# EasyEDA Pro project climbsnail-spotwelder-45c7d2f7.epro, board 大号mos板_16管
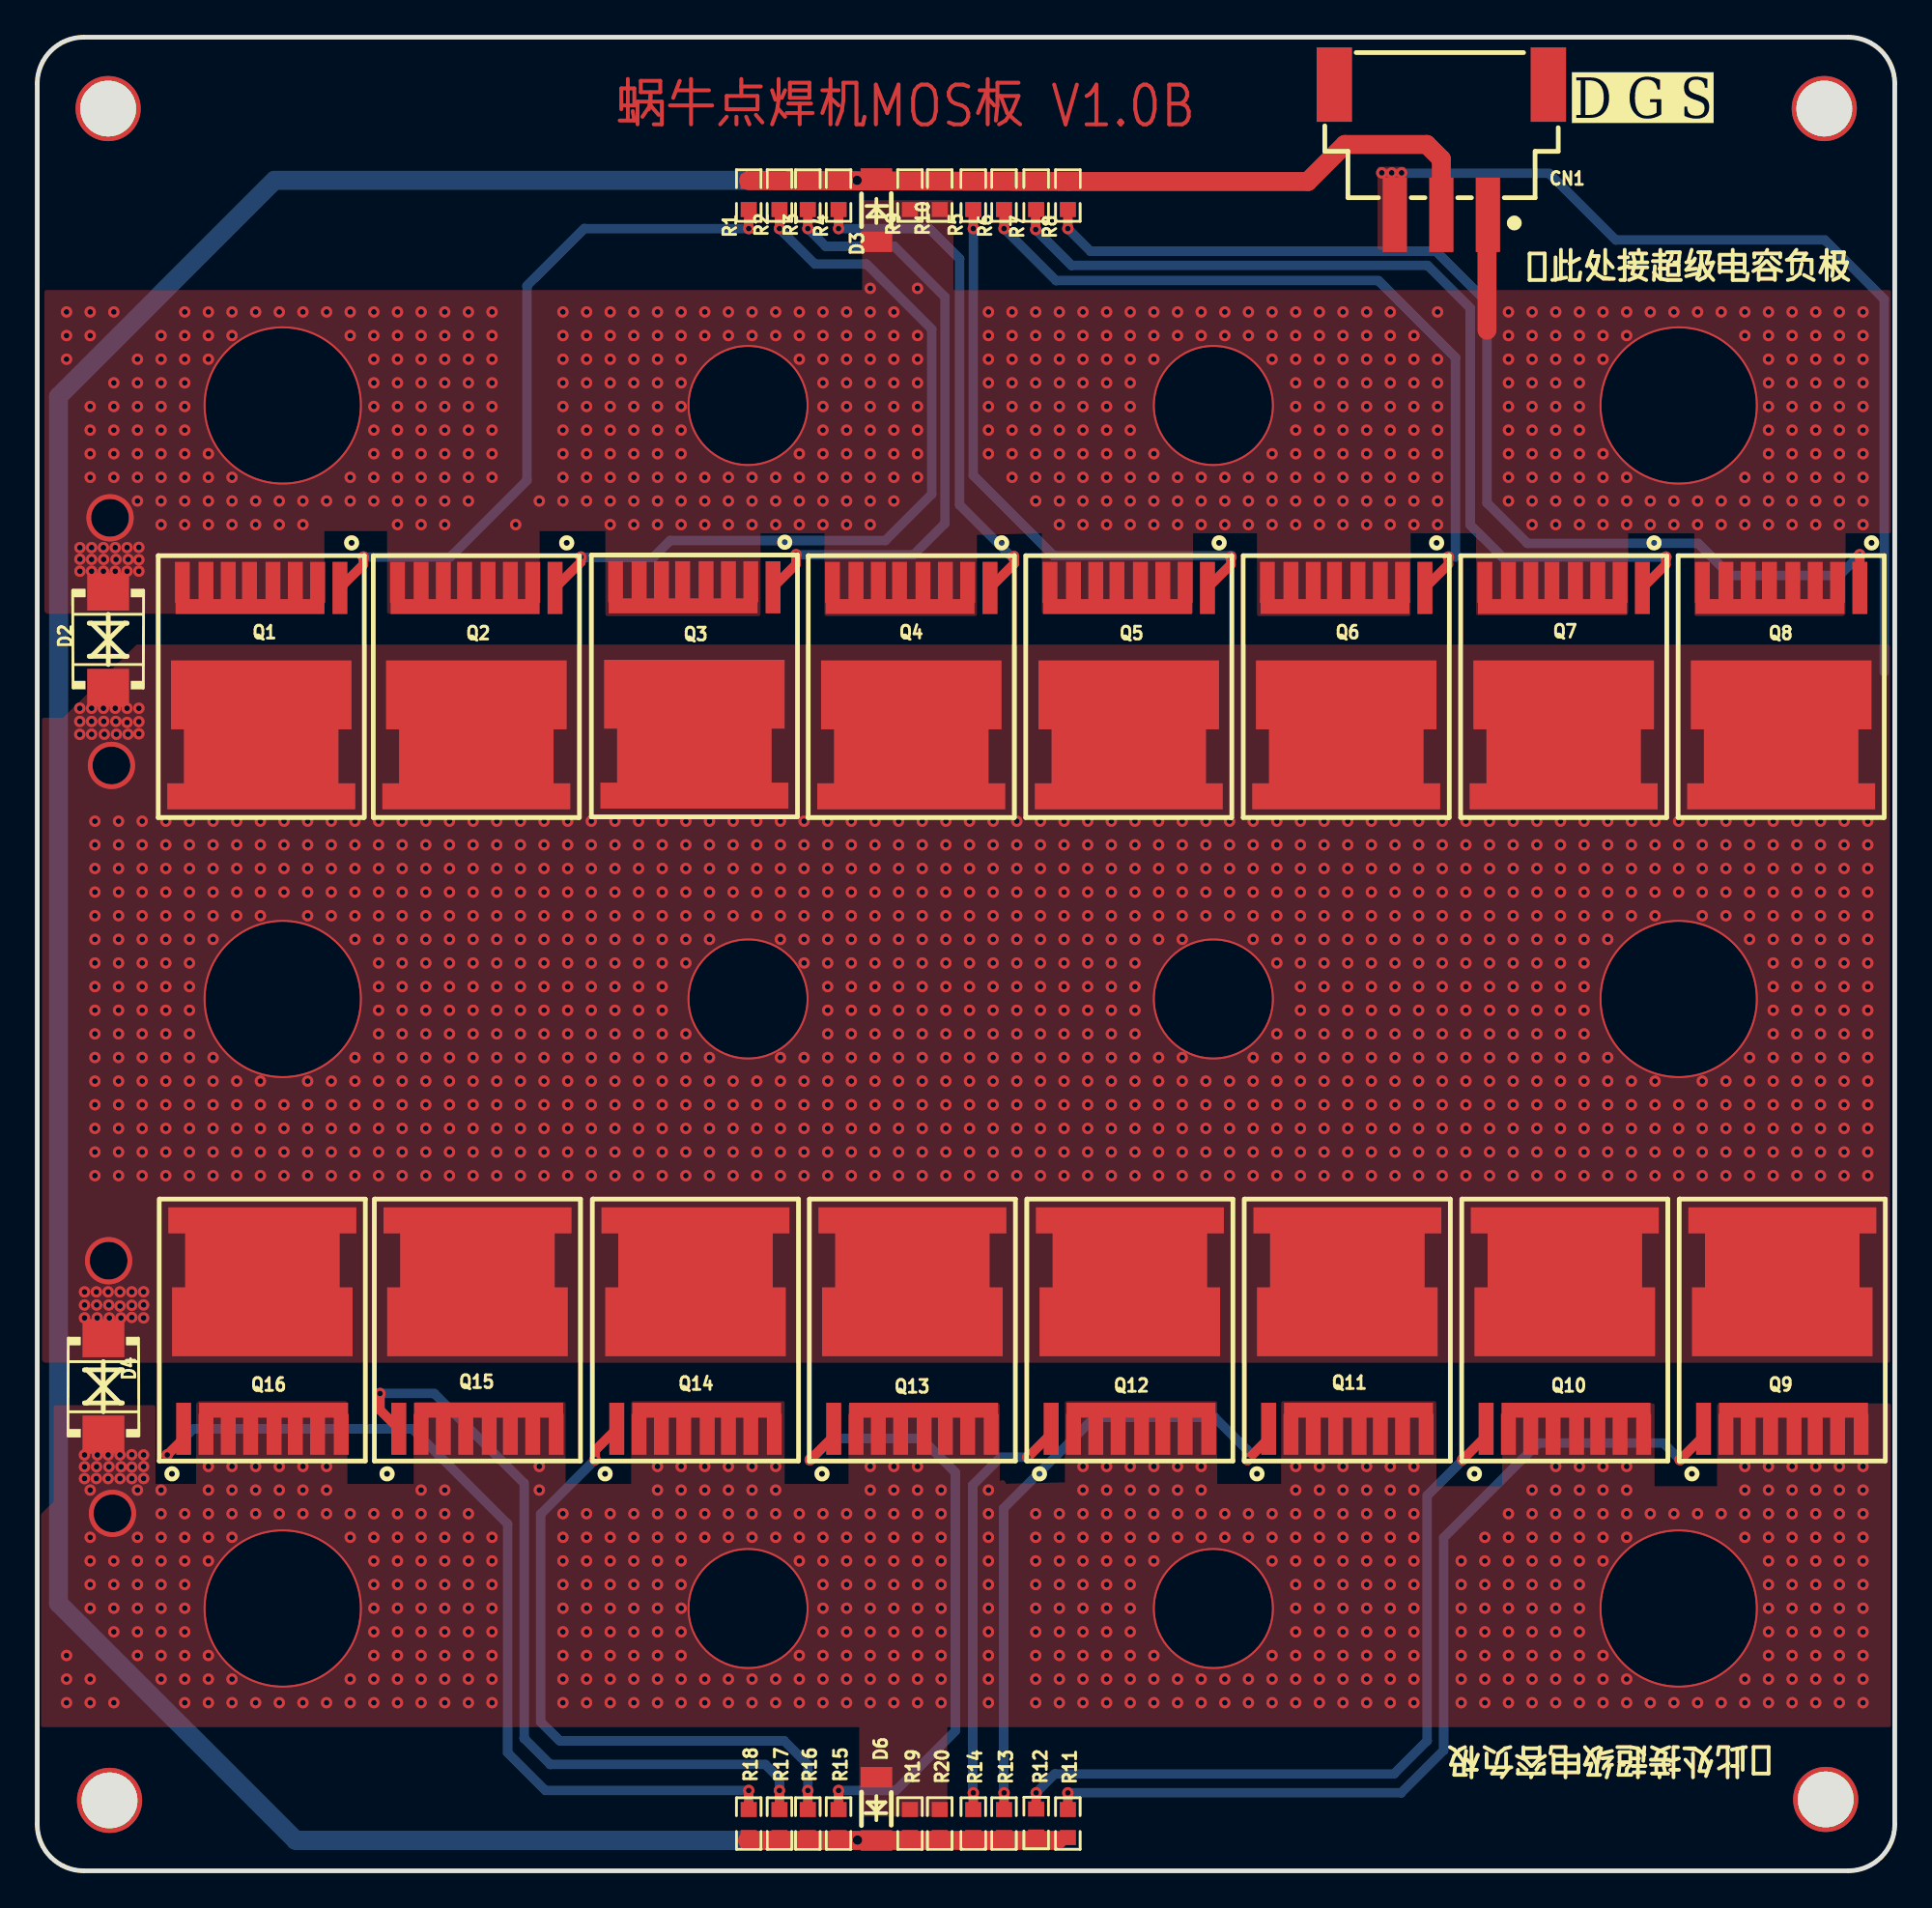
[diagram p12: board, top side]
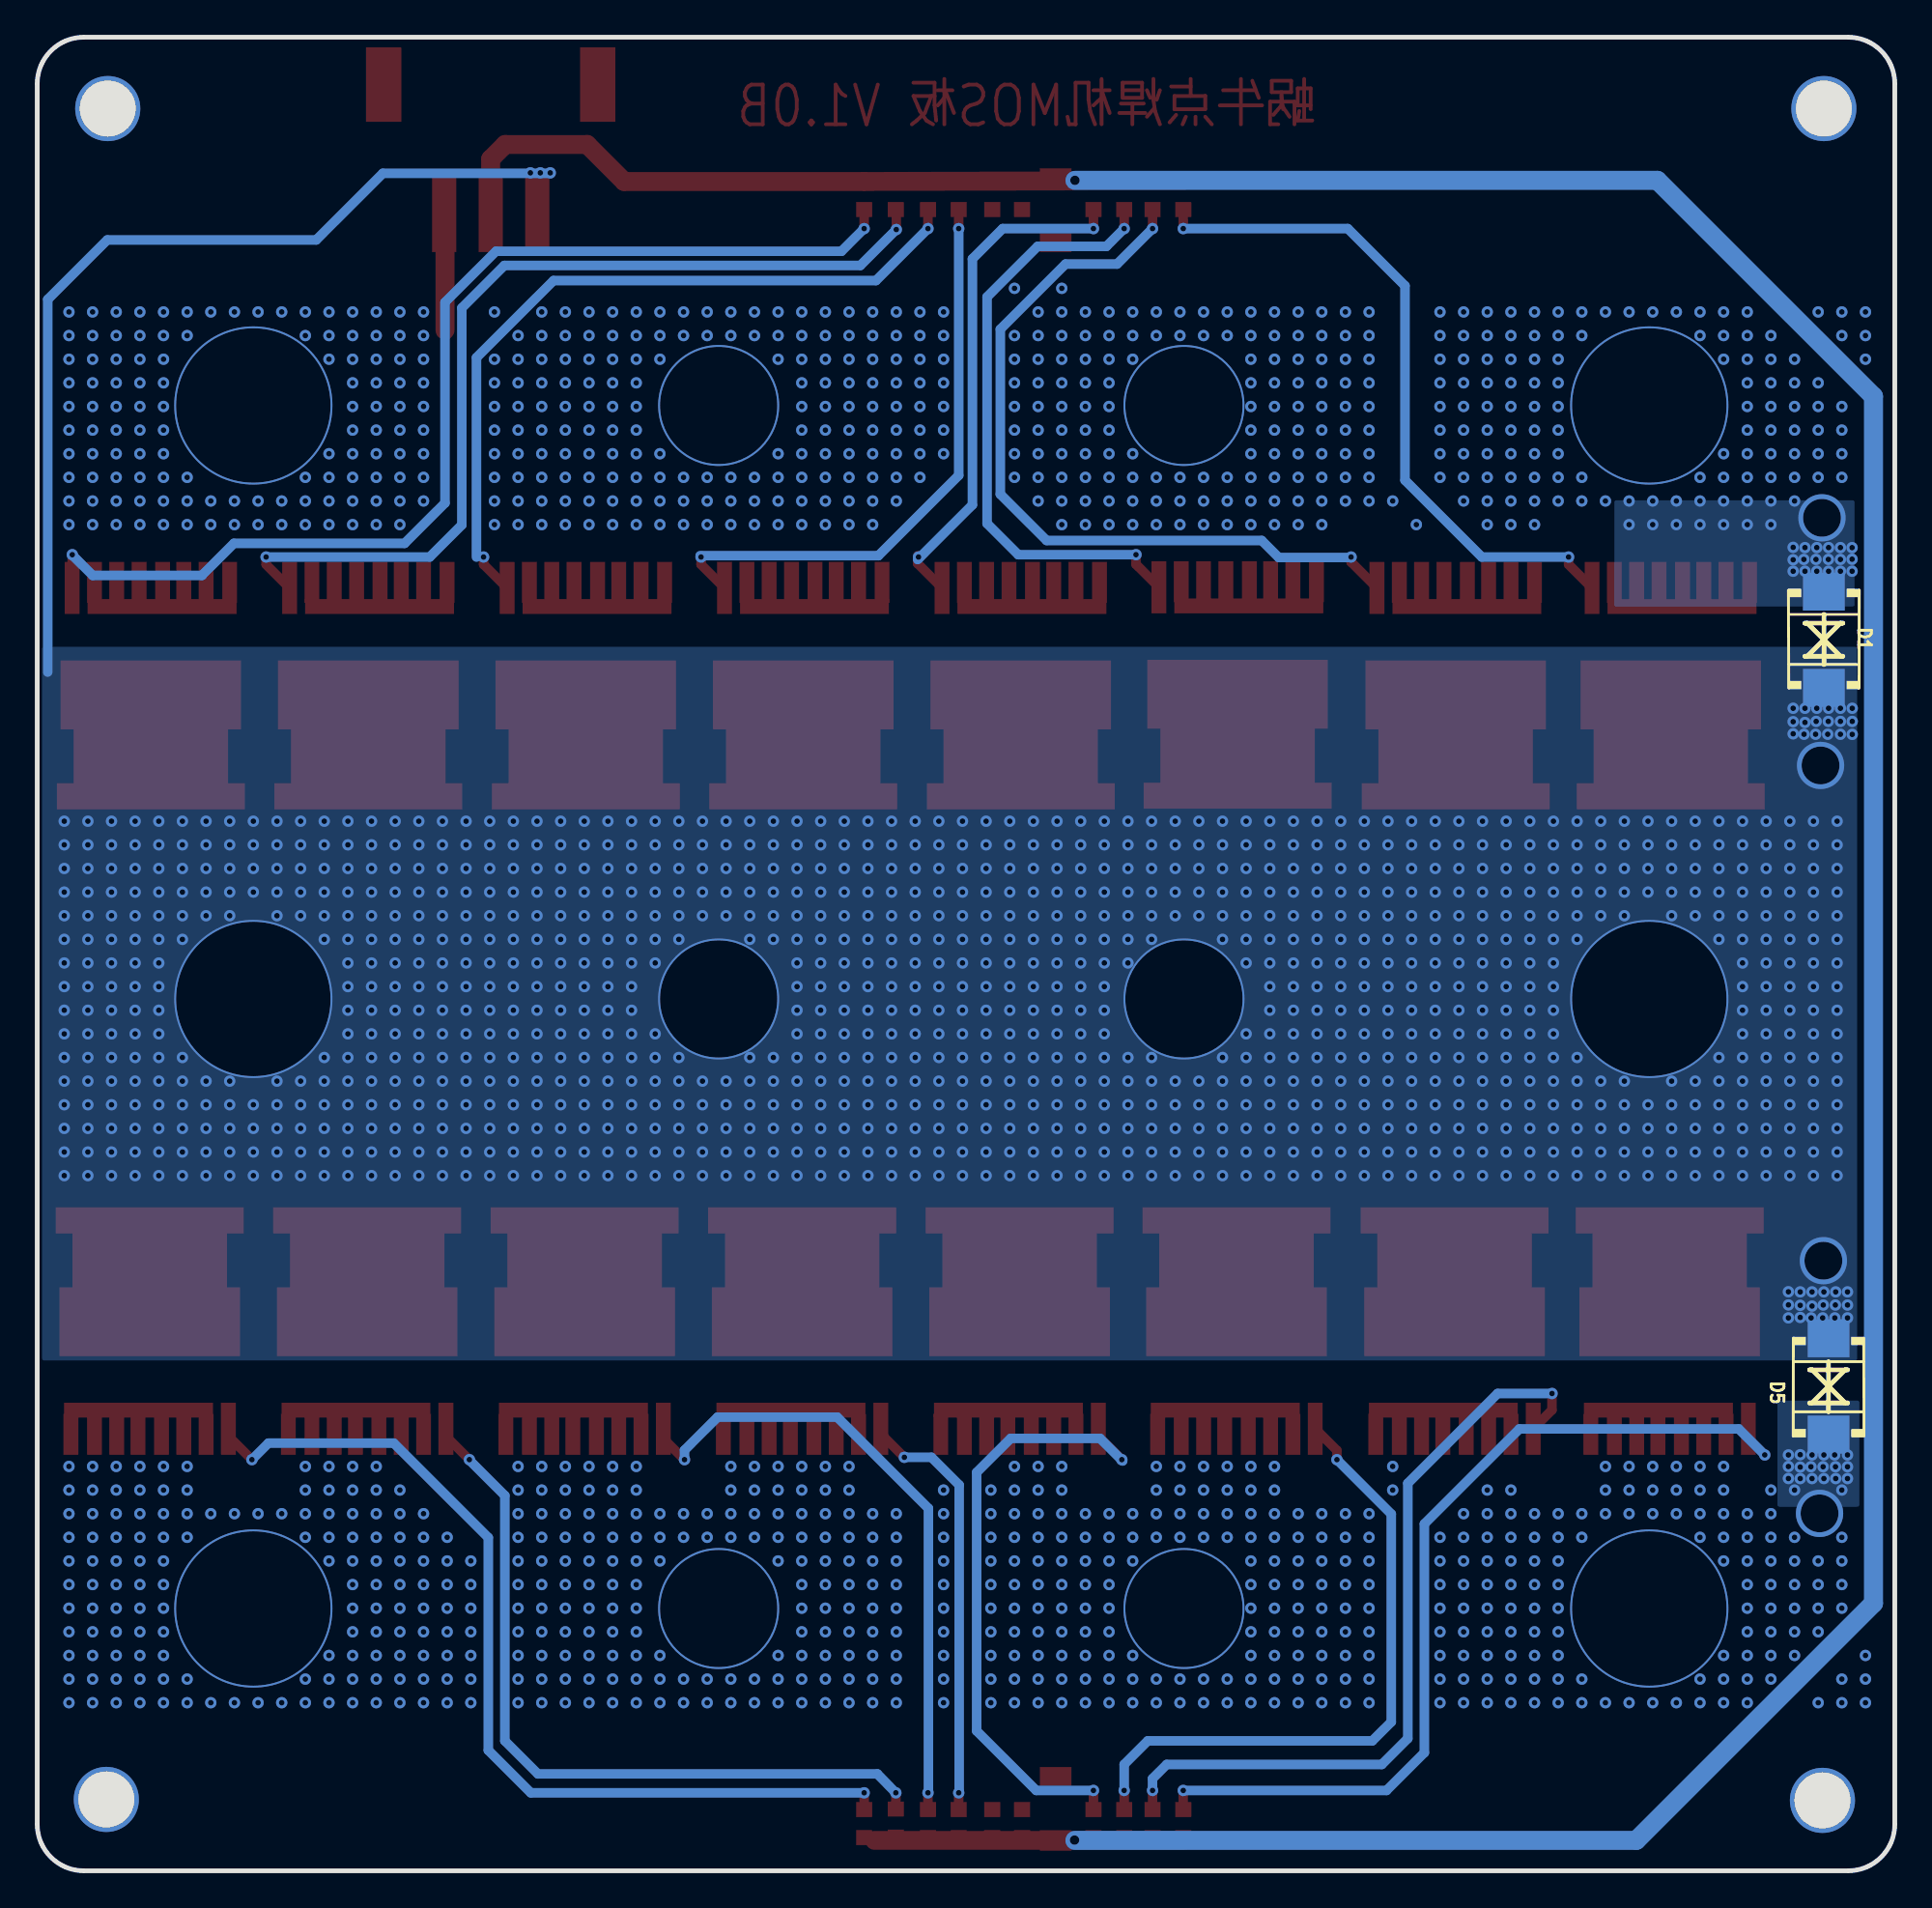
[diagram p13: board, bottom side, seen from below]

Outline 99.8 x 98.55 mm; copper layers: Top Layer, Bottom Layer. Coordinates in mm from the lower left corner of the outline.
Outline path: 0,96.05 0,2.5 arc(0.73,0.73) 2.5,0 97.3,0 arc(99.07,0.73) 99.8,2.5 99.8,96.05 arc(99.07,97.82) 97.3,98.55 2.5,98.55 arc(0.73,97.82) 0,96.05
Stack: Top Layer 0.035mm / Dielectric1 1.51mm FR4 er 4.5 / Bottom Layer 0.035mm

## Design rules (mm)
spacing safeClearance (default): track to track 0.152, other pairs 0.152 to 0.3
spacing Plane_innerPlane: track to track 0.152, other pairs 0.152 to 0.3
spacing Copper_copperRegion: track to track 0.152, other pairs 0.152 to 0.3
spacing Copper_GND: track to track 0.152, other pairs 0.152 to 0.3
track width trackWidth (default): min 0.127, default 0.254, max 2.54
differential pair differentialPair (default): width min 0.127, default 0.254, max 2.54; gap min 0.152, default 0.152
net GND uses GND
pour e2393 uses Copper_GND, copperRegion_Copper_GND
pour e2395 uses Copper_GND, copperRegion_Copper_GND
pour e2397 uses Copper_GND, copperRegion_Copper_GND
pour e2399 uses Copper_GND, copperRegion_Copper_GND
pour e2401 uses Copper_GND, copperRegion_Copper_GND
pour e2403 uses Copper_GND, copperRegion_Copper_GND
pour e2405 uses Copper_copperRegion, copperRegion_Copper_copperRegion
pour e2407 uses Copper_copperRegion, copperRegion_Copper_copperRegion
pour e2409 uses Copper_copperRegion, copperRegion_Copper_copperRegion
pour e2411 uses Copper_GND, copperRegion_Copper_GND

## Placement (name value [footprint] x y rotation side)
CN1  XH2.54-3P  [CONN-SMD_3P-P2.50-WT]  75.44 92.51 180 top
D1  SMBJ28CA双向TVS管  [SMB_L4.6-W3.6-LS5.3-BI]  3.81 66.17 90 bottom
D2  SMBJ28CA双向TVS管  [SMB_L4.6-W3.6-LS5.3-BI]  3.81 66.17 90 top
D3  ZMM18  [LL-34_L3.5-W1.5-RD]  45.09 89.26 270 top
D4  SMBJ28CA双向TVS管  [SMB_L4.6-W3.6-LS5.3-BI]  3.56 26.04 270 top
D5  SMBJ28CA双向TVS管  [SMB_L4.6-W3.6-LS5.3-BI]  3.56 26.04 270 bottom
D6  ZMM18  [LL-34_L3.5-W1.5-RD]  45.09 3.33 90 top
NOREF  -  [Pad_e2337]  3.81 94.72 0 top
NOREF#2  -  [Pad_e2335]  96.09 3.84 0 top
NOREF#3  -  [Pad_e2334]  96.01 94.72 0 top
NOREF#4  -  [Pad_e2336]  3.89 3.78 0 top
Q1  IPLU300N04S4  [HSOF-8_L10.0-W10.5-P1.20_1]  12.06 65.15 180 top
Q2  IPLU300N04S4  [HSOF-8_L10.0-W10.5-P1.20_1]  23.62 65.15 180 top
Q3  IPLU300N04S4  [HSOF-8_L10.0-W10.5-P1.20_1]  35.34 65.19 180 top
Q4  IPLU300N04S4  [HSOF-8_L10.0-W10.5-P1.20_1]  46.99 65.15 180 top
Q5  IPLU300N04S4  [HSOF-8_L10.0-W10.5-P1.20_1]  58.67 65.15 180 top
Q6  IPLU300N04S4  [HSOF-8_L10.0-W10.5-P1.20_1]  70.36 65.15 180 top
Q7  IPLU300N04S4  [HSOF-8_L10.0-W10.5-P1.20_1]  82.04 65.15 180 top
Q8  IPLU300N04S4  [HSOF-8_L10.0-W10.5-P1.20_1]  93.73 65.15 180 top
Q9  IPLU300N04S4  [HSOF-8_L10.0-W10.5-P1.20_1]  93.73 27.56 0 top
Q10  IPLU300N04S4  [HSOF-8_L10.0-W10.5-P1.20_1]  82.04 27.56 0 top
Q11  IPLU300N04S4  [HSOF-8_L10.0-W10.5-P1.20_1]  70.36 27.56 0 top
Q12  IPLU300N04S4  [HSOF-8_L10.0-W10.5-P1.20_1]  58.67 27.56 0 top
Q13  IPLU300N04S4  [HSOF-8_L10.0-W10.5-P1.20_1]  46.99 27.56 0 top
Q14  IPLU300N04S4  [HSOF-8_L10.0-W10.5-P1.20_1]  35.34 27.56 0 top
Q15  IPLU300N04S4  [HSOF-8_L10.0-W10.5-P1.20_1]  23.62 27.56 0 top
Q16  IPLU300N04S4  [HSOF-8_L10.0-W10.5-P1.20_1]  12.06 27.56 0 top
R1  20R  [R0603]  38.23 90.04 270 top
R2  20R  [R0603]  39.88 90.04 270 top
R3  20R  [R0603]  41.4 90.04 270 top
R4  20R  [R0603]  43.05 90.04 270 top
R5  20R  [R0603]  50.29 90.04 270 top
R6  20R  [R0603]  51.94 90.04 270 top
R7  20R  [R0603]  53.67 90.04 270 top
R8  20R  [R0603]  55.37 90.04 270 top
R9  10K  [R0603]  46.89 90.04 90 top
R10  10K  [R0603]  48.49 90.04 90 top
R11  20R  [R0603]  55.37 2.54 90 top
R12  20R  [R0603]  53.67 2.57 90 top
R13  20R  [R0603]  51.94 2.54 90 top
R14  20R  [R0603]  50.29 2.54 90 top
R15  20R  [R0603]  43.05 2.54 90 top
R16  20R  [R0603]  41.4 2.54 90 top
R17  20R  [R0603]  39.88 2.54 90 top
R18  20R  [R0603]  38.23 2.54 90 top
R19  10K  [R0603]  46.89 2.54 270 top
R20  10K  [R0603]  48.49 2.54 270 top

## Footprints (pads in the part's own frame, mm; a bottom-side part is the same pattern mirrored in y, then rotated)
CONN-SMD_3P-P2.50-WT
  rect 1.3x4 smd: 1(-2.499,3.5) 2(0,3.5) 3(2.499,3.5)
  rect 1.9x4 smd: 4(-5.75,-3.5) 5(5.75,-3.5)
HSOF-8_L10.0-W10.5-P1.20_1
  rect 0.8x2.799 smd: 1(-4.199,-3.8)
  rect 0.8x2.2 smd: 2(-2.999,-4.099) 3(-1.801,-4.099) 4(-0.6,-4.099) 6(1.801,-4.099) 7(2.999,-4.099)
  rect 8.001x0.8 smd: 2(0.632,-2.801)
  custom 0x0 smd: 5(0.6,-4.072) 8(4.201,-4.072) 9(0.03,4.099)
LL-34_L3.5-W1.5-RD
  rect 1.1x1.7 smd: 1(-1.7,0) 2(1.7,0)
Pad_e2334
  round 3.5 hole 3: 1(0,0)
Pad_e2335
  round 3.5 hole 3: 1(0,0)
Pad_e2336
  round 3.5 hole 3: 1(0,0)
Pad_e2337
  round 3.5 hole 3: 1(0,0)
R0603
  rect 0.806x0.864 smd: 1(-0.753,0) 2(0.753,0)
SMB_L4.6-W3.6-LS5.3-BI
  rect 2.047x2.241 smd: 1(-2.591,0) 2(2.591,0)

## Nets
As in the schematic.

Pads without a net: CN1 4 5; NOREF 1; NOREF#2 1; NOREF#3 1; NOREF#4 1

## Via types
v1: diameter 0.61, hole 0.305, Top Layer to Bottom Layer, 2315 vias
v2: diameter 8.5, hole 8.3, Top Layer to Bottom Layer, 6 vias
v3: diameter 6.5, hole 6.3, Top Layer to Bottom Layer, 6 vias
v4: diameter 2.54, hole 2.032, Top Layer to Bottom Layer, 4 vias
v5: diameter 0.762, hole 0.508, Top Layer to Bottom Layer, 2 vias

## Routing (per net, layer and track width the routed paths; a pad name or vN(x,y) marks a point on that pad's centre or on a via; arc(x,y) is an arc through that point)
GND:
  vias: v1(1.58,83.79) v1(1.58,82.52) v1(1.58,81.25) v1(1.58,11.57) v1(1.58,10.3) v1(1.58,9.03) v1(2.29,71.12) v1(2.29,70.5) v1(2.29,69.85) v1(2.54,22.35) v1(2.54,21.72) v1(2.54,21.08) v1(2.84,83.79) v1(2.84,82.52) v1(2.84,78.71) v1(2.84,77.44) v1(2.84,76.17) v1(2.84,74.9) v1(2.92,71.12) v1(2.92,70.49) v1(2.92,69.85) v1(2.84,20.46) v1(2.84,17.92) v1(2.84,16.65) v1(2.84,15.38) v1(2.84,14.11) v1(2.84,10.3) v1(2.84,9.03) v1(3.23,22.35) v1(3.19,21.72) v1(3.17,21.08) v1(3.56,71.12) v1(3.57,70.49) v1(3.56,69.85) v1(3.81,22.35) v1(3.81,21.08) v1(3.85,21.72) v1(4.11,83.79) v1(4.11,79.98) v1(4.11,78.71) v1(4.11,77.44) v1(4.11,76.17) v1(4.11,74.9) v1(4.11,16.65) v1(4.11,15.38) v1(4.11,14.11) v1(4.11,12.84) v1(4.11,9.03) v1(4.19,71.12) v1(4.23,70.49) v1(4.19,69.85) v1(4.44,22.35) v1(4.5,21.72) v1(4.44,21.08) v1(4.83,71.12) v1(4.83,69.85) v1(4.89,70.49) v1(5.08,22.36) v1(5.08,21.7) v1(5.08,21.08) v1(5.38,81.25) v1(5.38,79.98) v1(5.38,78.71) v1(5.38,77.44) v1(5.38,76.17) v1(5.38,74.9) v1(5.38,73.63) v1(5.38,20.46) v1(5.38,17.92) v1(5.38,16.65) v1(5.38,15.38) v1(5.38,14.11) v1(5.38,12.84) v1(5.38,11.57) v1(5.46,71.13) v1(5.46,70.47) v1(5.46,69.85) v1(5.72,22.35) v1(5.72,21.73) v1(5.72,21.09) v1(6.66,82.52) v1(6.66,81.25) v1(6.66,79.98) v1(6.66,78.71) v1(6.66,77.44) v1(6.66,76.17) v1(6.66,74.9) v1(6.66,73.63) v1(6.66,72.36) v1(6.66,20.46) v1(6.66,19.19) v1(6.66,17.92) v1(6.66,16.65) v1(6.66,15.38) v1(6.66,14.11) v1(6.66,12.84) v1(6.66,11.57) v1(6.66,10.3) v1(7.92,83.79) v1(7.92,82.52) v1(7.92,81.25) v1(7.92,79.98) v1(7.92,78.71) v1(7.92,77.44) v1(7.92,76.17) v1(7.92,74.9) v1(7.92,73.63) v1(7.92,72.36) v1(7.92,19.19) v1(7.92,17.92) v1(7.92,16.65) v1(7.92,15.38) v1(7.92,14.11) v1(7.92,12.84) v1(7.92,11.57) v1(7.92,10.3) v1(7.92,9.03) v1(9.19,83.79) v1(9.19,82.52) v1(9.19,81.25) v1(9.19,76.17) v1(9.19,74.9) v1(9.19,73.63) v1(9.19,72.36) v1(9.19,21.73) v1(9.19,20.46) v1(9.19,19.19) v1(9.19,17.92) v1(9.19,16.65) v1(9.19,11.57) v1(9.19,10.3) v1(9.19,9.03) v1(10.47,83.79) v1(10.47,82.52) v1(10.47,74.9) v1(10.47,73.63) v1(10.47,72.36) v1(10.47,21.73) v1(10.47,20.46) v1(10.47,19.19) v1(10.47,17.92) v1(10.47,10.3) v1(10.47,9.03) v1(11.73,83.79) v1(11.73,73.63) v1(11.73,72.36) v1(11.73,21.73) v1(11.73,20.46) v1(11.73,19.19) v1(11.73,9.03) v1(13,83.79) v1(13,73.63) v1(13,72.36) v1(13,21.73) v1(13,20.46) v1(13,19.19) v1(13,9.03) v1(14.27,83.79) v1(14.27,73.63) v1(14.27,72.36) v1(14.27,21.73) v1(14.27,20.46) v1(14.27,19.19) v1(14.27,9.03) v1(15.55,83.79) v1(15.55,73.63) v1(15.55,21.73) v1(15.55,20.46) v1(15.55,19.19) v1(15.55,9.03) v1(16.81,83.79) v1(16.81,82.52) v1(16.81,74.9) v1(16.81,73.63) v1(16.81,19.19) v1(16.81,17.92) v1(16.81,10.3) v1(16.81,9.03) v1(18.08,83.79) v1(18.08,82.52) v1(18.08,81.25) v1(18.08,79.98) v1(18.08,78.71) v1(18.08,77.44) v1(18.08,76.17) v1(18.08,74.9) v1(18.08,73.63) v1(18.08,19.19) v1(18.08,17.92) v1(18.08,16.65) v1(18.08,15.38) v1(18.08,14.11) v1(18.08,12.84) v1(18.08,11.57) v1(18.08,10.3) v1(18.08,9.03) v1(19.36,83.79) v1(19.36,82.52) v1(19.36,81.25) v1(19.36,79.98) v1(19.36,78.71) v1(19.36,77.44) v1(19.36,76.17) v1(19.36,74.9) v1(19.36,73.63) v1(19.36,72.36) v1(19.36,19.19) v1(19.36,17.92) v1(19.36,16.65) v1(19.36,15.38) v1(19.36,14.11) v1(19.36,12.84) v1(19.36,11.57) v1(19.36,10.3) v1(19.36,9.03) v1(20.62,83.79) v1(20.62,82.52) v1(20.62,81.25) v1(20.62,79.98) v1(20.62,78.71) v1(20.62,77.44) v1(20.62,76.17) v1(20.62,74.9) v1(20.62,73.63) v1(20.62,72.36) v1(20.62,20.46) v1(20.62,19.19) v1(20.62,17.92) v1(20.62,16.65) v1(20.62,15.38) v1(20.62,14.11) v1(20.62,12.84) v1(20.62,11.57) v1(20.62,10.3) v1(20.62,9.03) v1(21.89,83.79) v1(21.89,82.52) v1(21.89,81.25) v1(21.89,79.98) v1(21.89,78.71) v1(21.89,77.44) v1(21.89,76.17) v1(21.89,74.9) v1(21.89,73.63) v1(21.89,72.36) v1(21.89,20.46) v1(21.89,19.19) v1(21.89,17.92) v1(21.89,16.65) v1(21.89,15.38) v1(21.89,14.11) v1(21.89,12.84) v1(21.89,11.57) v1(21.89,10.3) v1(21.89,9.03) v1(23.16,83.79) v1(23.16,82.52) v1(23.16,81.25) v1(23.16,79.98) v1(23.16,78.71) v1(23.16,77.44) v1(23.16,76.17) v1(23.16,74.9) v1(23.16,73.63) v1(23.16,19.19) v1(23.16,17.92) v1(23.16,16.65) v1(23.16,15.38) v1(23.16,14.11) v1(23.16,12.84) v1(23.16,11.57) v1(23.16,10.3) v1(23.16,9.03) v1(24.44,83.79) v1(24.44,82.52) v1(24.44,81.25) v1(24.44,79.98) v1(24.44,78.71) v1(24.44,77.44) v1(24.44,76.17) v1(24.44,74.9) v1(24.44,17.92) v1(24.44,16.65) v1(24.44,15.38) v1(24.44,14.11) v1(24.44,12.84) v1(24.44,11.57) v1(24.44,10.3) v1(24.44,9.03) v1(25.7,72.36) v1(26.97,73.63) v1(26.97,21.73) v1(26.97,20.46) v1(28.25,83.79) v1(28.25,82.52) v1(28.25,81.25) v1(28.25,79.98) v1(28.25,78.71) v1(28.25,77.44) v1(28.25,76.17) v1(28.25,74.9) v1(28.25,73.63) v1(28.25,19.19) v1(28.25,17.92) v1(28.25,16.65) v1(28.25,15.38) v1(28.25,14.11) v1(28.25,12.84) v1(28.25,11.57) v1(28.25,10.3) v1(28.25,9.03) v1(29.52,83.79) v1(29.52,82.52) v1(29.52,81.25) v1(29.52,79.98) v1(29.52,78.71) v1(29.52,77.44) v1(29.52,76.17) v1(29.52,74.9) v1(29.52,73.63) v1(29.52,19.19) v1(29.52,17.92) v1(29.52,16.65) v1(29.52,15.38) v1(29.52,14.11) v1(29.52,12.84) v1(29.52,11.57) v1(29.52,10.3) v1(29.52,9.03) v1(30.78,83.79) v1(30.78,82.52) v1(30.78,81.25) v1(30.78,79.98) v1(30.78,78.71) v1(30.78,77.44) v1(30.78,76.17) v1(30.78,74.9) v1(30.78,73.63) v1(30.78,72.36) v1(30.78,19.19) v1(30.78,17.92) v1(30.78,16.65) v1(30.78,15.38) v1(30.78,14.11) v1(30.78,12.84) v1(30.78,11.57) v1(30.78,10.3) v1(30.78,9.03) v1(32.05,83.79) v1(32.05,82.52) v1(32.05,81.25) v1(32.05,79.98) v1(32.05,78.71) v1(32.05,77.44) v1(32.05,76.17) v1(32.05,74.9) v1(32.05,73.63) v1(32.05,72.36) v1(32.05,19.19) v1(32.05,17.92) v1(32.05,16.65) v1(32.05,15.38) v1(32.05,14.11) v1(32.05,12.84) v1(32.05,11.57) v1(32.05,10.3) v1(32.05,9.03) v1(33.33,83.79) v1(33.33,82.52) v1(33.33,81.25) v1(33.33,79.98) v1(33.33,78.71) v1(33.33,77.44) v1(33.33,76.17) v1(33.33,74.9) v1(33.33,73.63) v1(33.33,72.36) v1(33.33,21.73) v1(33.33,20.46) v1(33.33,19.19) v1(33.33,17.92) v1(33.33,16.65) v1(33.33,15.38) v1(33.33,14.11) v1(33.33,12.84) v1(33.33,11.57) v1(33.33,10.3) v1(33.33,9.03) v1(34.59,83.79) v1(34.59,82.52) v1(34.59,81.25) v1(34.59,79.98) v1(34.59,78.71) v1(34.59,77.44) v1(34.59,76.17) v1(34.59,74.9) v1(34.59,73.63) v1(34.59,72.36) v1(34.59,21.73) v1(34.59,20.46) v1(34.59,19.19) v1(34.59,17.92) v1(34.59,16.65) v1(34.59,15.38) v1(34.59,14.11) v1(34.59,12.84) v1(34.59,11.57) v1(34.59,10.3) v1(34.59,9.03) v1(35.87,83.79) v1(35.87,82.52) v1(35.87,74.9) v1(35.87,73.63) v1(35.87,72.36) v1(35.87,21.73) v1(35.87,20.46) v1(35.87,19.19) v1(35.87,17.92) v1(35.87,10.3) v1(35.87,9.03) v1(37.13,83.79) v1(37.13,82.52) v1(37.13,74.9) v1(37.13,73.63) v1(37.13,72.36) v1(37.13,21.73) v1(37.13,20.46) v1(37.13,19.19) v1(37.13,17.92) v1(37.13,10.3) v1(37.13,9.03) v1(38.41,83.79) v1(38.41,82.52) v1(38.41,74.9) v1(38.41,73.63) v1(38.41,72.36) v1(38.41,21.73) v1(38.41,20.46) v1(38.41,19.19) v1(38.41,17.92) v1(38.41,10.3) v1(38.41,9.03) v1(39.68,83.79) v1(39.68,82.52) v1(39.68,74.9) v1(39.68,73.63) v1(39.68,72.36) v1(39.68,21.73) v1(39.68,20.46) v1(39.68,19.19) v1(39.68,17.92) v1(39.68,10.3) v1(39.68,9.03) v1(40.94,83.79) v1(40.94,82.52) v1(40.94,81.25) v1(40.94,76.17) v1(40.94,74.9) v1(40.94,73.63) v1(40.94,72.36) v1(40.94,19.19) v1(40.94,17.92) v1(40.94,16.65) v1(40.94,11.57) v1(40.94,10.3) v1(40.94,9.03) v1(42.22,83.79) v1(42.22,82.52) v1(42.22,81.25) v1(42.22,79.98) v1(42.22,78.71) v1(42.22,77.44) v1(42.22,76.17) v1(42.22,74.9) v1(42.22,73.63) v1(42.22,72.36) v1(42.22,19.19) v1(42.22,17.92) v1(42.22,16.65) v1(42.22,15.38) v1(42.22,14.11) v1(42.22,12.84) v1(42.22,11.57) v1(42.22,10.3) v1(42.22,9.03) v1(43.48,83.79) v1(43.48,82.52) v1(43.48,81.25) v1(43.48,79.98) v1(43.48,78.71) v1(43.48,77.44) v1(43.48,76.17) v1(43.48,74.9) v1(43.48,73.63) v1(43.48,72.36) v1(43.48,19.19) v1(43.48,17.92) v1(43.48,16.65) v1(43.48,15.38) v1(43.48,14.11) v1(43.48,12.84) v1(43.48,11.57) v1(43.48,10.3) v1(43.48,9.03) v1(44.75,85.06) v1(44.75,83.79) v1(44.75,82.52) v1(44.75,81.25) v1(44.75,79.98) v1(44.75,78.71) v1(44.75,77.44) v1(44.75,76.17) v1(44.75,74.9) v1(44.75,73.63) v1(44.75,72.36) v1(44.75,21.73) v1(44.75,20.46) v1(44.75,19.19) v1(44.75,17.92) v1(44.75,16.65) v1(44.75,15.38) v1(44.75,14.11) v1(44.75,12.84) v1(44.75,11.57) v1(44.75,10.3) v1(44.75,9.03) v1(46.03,83.79) v1(46.03,82.52) v1(46.03,81.25) v1(46.03,79.98) v1(46.03,78.71) v1(46.03,77.44) v1(46.03,76.17) v1(46.03,74.9) v1(46.03,73.63) v1(46.03,21.73) v1(46.03,20.46) v1(46.03,19.19) v1(46.03,17.92) v1(46.03,16.65) v1(46.03,15.38) v1(46.03,14.11) v1(46.03,12.84) v1(46.03,11.57) v1(46.03,10.3) v1(46.03,9.03) v1(47.29,85.06) v1(47.29,82.52) v1(47.29,81.25) v1(47.29,79.98) v1(47.29,78.71) v1(47.29,77.44) v1(47.29,76.17) v1(47.29,74.9) v1(47.29,21.73) v1(47.29,20.46) v1(47.29,19.19) v1(47.29,17.92) v1(47.29,16.65) v1(47.29,15.38) v1(47.29,14.11) v1(47.29,12.84) v1(47.29,11.57) v1(47.29,10.3) v1(47.29,9.03) v1(48.56,20.46) v1(48.56,19.19) v1(48.56,17.92) v1(48.56,16.65) v1(48.56,15.38) v1(48.56,14.11) v1(48.56,12.84) v1(48.56,11.57) v1(48.56,10.3) v1(48.56,9.03) v1(51.1,83.79) v1(51.1,82.52) v1(51.1,81.25) v1(51.1,79.98) v1(51.1,78.71) v1(51.1,77.44) v1(51.1,76.17) v1(51.1,20.46) v1(51.1,19.19) v1(51.1,17.92) v1(51.1,16.65) v1(51.1,15.38) v1(51.1,14.11) v1(51.1,12.84) v1(51.1,11.57) v1(51.1,10.3) v1(51.1,9.03) v1(52.38,83.79) v1(52.38,82.52) v1(52.38,81.25) v1(52.38,79.98) v1(52.38,78.71) v1(52.38,77.44) v1(52.38,76.17) v1(52.38,74.9) v1(53.65,83.79) v1(53.65,82.52) v1(53.65,81.25) v1(53.65,79.98) v1(53.65,78.71) v1(53.65,77.44) v1(53.65,76.17) v1(53.65,74.9) v1(53.65,73.63) v1(53.65,19.19) v1(53.65,17.92) v1(53.65,16.65) v1(53.65,15.38) v1(53.65,14.11) v1(53.65,12.84) v1(53.65,11.57) v1(53.65,10.3) v1(53.65,9.03) v1(54.91,83.79) v1(54.91,82.52) v1(54.91,81.25) v1(54.91,79.98) v1(54.91,78.71) v1(54.91,77.44) v1(54.91,76.17) v1(54.91,74.9) v1(54.91,73.63) v1(54.91,72.36) v1(54.91,19.19) v1(54.91,17.92) v1(54.91,16.65) v1(54.91,15.38) v1(54.91,14.11) v1(54.91,12.84) v1(54.91,11.57) v1(54.91,10.3) v1(54.91,9.03) v1(56.19,83.79) v1(56.19,82.52) v1(56.19,81.25) v1(56.19,79.98) v1(56.19,78.71) v1(56.19,77.44) v1(56.19,76.17) v1(56.19,74.9) v1(56.19,73.63) v1(56.19,72.36) v1(56.19,21.73) v1(56.19,20.46) v1(56.19,19.19) v1(56.19,17.92) v1(56.19,16.65) v1(56.19,15.38) v1(56.19,14.11) v1(56.19,12.84) v1(56.19,11.57) v1(56.19,10.3) v1(56.19,9.03) v1(57.45,83.79) v1(57.45,82.52) v1(57.45,81.25) v1(57.45,79.98) v1(57.45,78.71) v1(57.45,77.44) v1(57.45,76.17) v1(57.45,74.9) v1(57.45,73.63) v1(57.45,72.36) v1(57.45,21.73) v1(57.45,20.46) v1(57.45,19.19) v1(57.45,17.92) v1(57.45,16.65) v1(57.45,15.38) v1(57.45,14.11) v1(57.45,12.84) v1(57.45,11.57) v1(57.45,10.3) v1(57.45,9.03) v1(58.72,83.79) v1(58.72,82.52) v1(58.72,81.25) v1(58.72,79.98) v1(58.72,78.71) v1(58.72,77.44) v1(58.72,76.17) v1(58.72,74.9) v1(58.72,73.63) v1(58.72,72.36) v1(58.72,21.73) v1(58.72,20.46) v1(58.72,19.19) v1(58.72,17.92) v1(58.72,16.65) v1(58.72,15.38) v1(58.72,14.11) v1(58.72,12.84) v1(58.72,11.57) v1(58.72,10.3) v1(58.72,9.03) v1(60,83.79) v1(60,82.52) v1(60,81.25) v1(60,76.17) v1(60,74.9) v1(60,73.63) v1(60,72.36) v1(60,21.73) v1(60,20.46) v1(60,19.19) v1(60,17.92) v1(60,16.65) v1(60,11.57) v1(60,10.3) v1(60,9.03) v1(61.26,83.79) v1(61.26,82.52) v1(61.26,74.9) v1(61.26,73.63) v1(61.26,72.36) v1(61.26,21.73) v1(61.26,20.46) v1(61.26,19.19) v1(61.26,17.92) v1(61.26,10.3) v1(61.26,9.03) v1(62.53,83.79) v1(62.53,82.52) v1(62.53,74.9) v1(62.53,73.63) v1(62.53,72.36) v1(62.53,21.73) v1(62.53,20.46) v1(62.53,19.19) v1(62.53,17.92) v1(62.53,10.3) v1(62.53,9.03) v1(63.81,83.79) v1(63.81,82.52) v1(63.81,74.9) v1(63.81,73.63) v1(63.81,72.36) v1(63.81,19.19) v1(63.81,17.92) v1(63.81,10.3) v1(63.81,9.03) v1(65.07,83.79) v1(65.07,82.52) v1(65.07,74.9) v1(65.07,73.63) v1(65.07,72.36) v1(65.07,19.19) v1(65.07,17.92) v1(65.07,10.3) v1(65.07,9.03) v1(66.34,83.79) v1(66.34,82.52) v1(66.34,81.25) v1(66.34,76.17) v1(66.34,74.9) v1(66.34,73.63) v1(66.34,72.36) v1(66.34,19.19) v1(66.34,17.92) v1(66.34,16.65) v1(66.34,11.57) v1(66.34,10.3) v1(66.34,9.03) v1(67.62,83.79) v1(67.62,82.52) v1(67.62,81.25) v1(67.62,79.98) v1(67.62,78.71) v1(67.62,77.44) v1(67.62,76.17) v1(67.62,74.9) v1(67.62,73.63) v1(67.62,72.36) v1(67.62,21.73) v1(67.62,20.46) v1(67.62,19.19) v1(67.62,17.92) v1(67.62,16.65) v1(67.62,15.38) v1(67.62,14.11) v1(67.62,12.84) v1(67.62,11.57) v1(67.62,10.3) v1(67.62,9.03) v1(68.88,83.79) v1(68.88,82.52) v1(68.88,81.25) v1(68.88,79.98) v1(68.88,78.71) v1(68.88,77.44) v1(68.88,76.17) v1(68.88,74.9) v1(68.88,73.63) v1(68.88,72.36) v1(68.88,21.73) v1(68.88,20.46) v1(68.88,19.19) v1(68.88,17.92) v1(68.88,16.65) v1(68.88,15.38) v1(68.88,14.11) v1(68.88,12.84) v1(68.88,11.57) v1(68.88,10.3) v1(68.88,9.03) v1(70.16,83.79) v1(70.16,82.52) v1(70.16,81.25) v1(70.16,79.98) v1(70.16,78.71) v1(70.16,77.44) v1(70.16,76.17) v1(70.16,74.9) v1(70.16,73.63) v1(70.16,72.36) v1(70.16,21.73) v1(70.16,20.46) v1(70.16,19.19) v1(70.16,17.92) v1(70.16,16.65) v1(70.16,15.38) v1(70.16,14.11) v1(70.16,12.84) v1(70.16,11.57) v1(70.16,10.3) v1(70.16,9.03) v1(71.43,83.79) v1(71.43,82.52) v1(71.43,81.25) v1(71.43,79.98) v1(71.43,78.71) v1(71.43,77.44) v1(71.43,76.17) v1(71.43,74.9) v1(71.43,73.63) v1(71.43,72.36) v1(71.43,21.73) v1(71.43,20.46) v1(71.43,19.19) v1(71.43,17.92) v1(71.43,16.65) v1(71.43,15.38) v1(71.43,14.11) v1(71.43,12.84) v1(71.43,11.57) v1(71.43,10.3) v1(71.43,9.03) v1(72.69,83.79) v1(72.69,82.52) v1(72.69,81.25) v1(72.69,79.98) v1(72.69,78.71) v1(72.69,77.44) v1(72.69,76.17) v1(72.69,74.9) v1(72.69,73.63) v1(72.69,72.36) v1(72.69,21.73) v1(72.69,20.46) v1(72.69,19.19) v1(72.69,17.92) v1(72.69,16.65) v1(72.69,15.38) v1(72.69,14.11) v1(72.69,12.84) v1(72.69,11.57) v1(72.69,10.3) v1(72.69,9.03) v1(73.97,82.52) v1(73.97,81.25) v1(73.97,79.98) v1(73.97,78.71) v1(73.97,77.44) v1(73.97,76.17) v1(73.97,74.9) v1(73.97,73.63) v1(73.97,72.36) v1(73.97,21.73) v1(73.97,20.46) v1(73.97,19.19) v1(73.97,17.92) v1(73.97,16.65) v1(73.97,15.38) v1(73.97,14.11) v1(73.97,12.84) v1(73.97,11.57) v1(73.97,10.3) v1(73.97,9.03) v1(75.23,83.79) v1(75.23,81.25) v1(75.23,79.98) v1(75.23,78.71) v1(75.23,77.44) v1(75.23,76.17) v1(75.23,74.9) v1(75.23,73.63) v1(75.23,72.36) v1(76.5,16.65) v1(76.5,15.38) v1(76.5,14.11) v1(76.5,12.84) v1(76.5,11.57) v1(76.5,10.3) v1(76.5,9.03) v1(77.78,17.92) v1(77.78,16.65) v1(77.78,15.38) v1(77.78,14.11) v1(77.78,12.84) v1(77.78,11.57) v1(77.78,10.3) v1(77.78,9.03) v1(79.04,83.79) v1(79.04,82.52) v1(79.04,81.25) v1(79.04,79.98) v1(79.04,78.71) v1(79.04,77.44) v1(79.04,76.17) v1(79.04,74.9) v1(79.04,73.63) v1(79.04,19.19) v1(79.04,17.92) v1(79.04,16.65) v1(79.04,15.38) v1(79.04,14.11) v1(79.04,12.84) v1(79.04,11.57) v1(79.04,10.3) v1(79.04,9.03) v1(80.31,83.79) v1(80.31,82.52) v1(80.31,81.25) v1(80.31,79.98) v1(80.31,78.71) v1(80.31,77.44) v1(80.31,76.17) v1(80.31,74.9) v1(80.31,73.63) v1(80.31,72.36) v1(80.31,20.46) v1(80.31,19.19) v1(80.31,17.92) v1(80.31,16.65) v1(80.31,15.38) v1(80.31,14.11) v1(80.31,12.84) v1(80.31,11.57) v1(80.31,10.3) v1(80.31,9.03) v1(81.59,83.79) v1(81.59,82.52) v1(81.59,81.25) v1(81.59,79.98) v1(81.59,78.71) v1(81.59,77.44) v1(81.59,76.17) v1(81.59,74.9) v1(81.59,73.63) v1(81.59,72.36) v1(81.59,21.73) v1(81.59,20.46) v1(81.59,19.19) v1(81.59,17.92) v1(81.59,16.65) v1(81.59,15.38) v1(81.59,14.11) v1(81.59,12.84) v1(81.59,11.57) v1(81.59,10.3) v1(81.59,9.03) v1(82.85,83.79) v1(82.85,82.52) v1(82.85,81.25) v1(82.85,79.98) v1(82.85,78.71) v1(82.85,77.44) v1(82.85,76.17) v1(82.85,74.9) v1(82.85,73.63) v1(82.85,72.36) v1(82.85,21.73) v1(82.85,20.46) v1(82.85,19.19) v1(82.85,17.92) v1(82.85,16.65) v1(82.85,15.38) v1(82.85,14.11) v1(82.85,12.84) v1(82.85,11.57) v1(82.85,10.3) v1(82.85,9.03) v1(84.12,83.79) v1(84.12,82.52) v1(84.12,81.25) v1(84.12,76.17) v1(84.12,74.9) v1(84.12,73.63) v1(84.12,72.36) v1(84.12,21.73) v1(84.12,20.46) v1(84.12,19.19) v1(84.12,17.92) v1(84.12,16.65) v1(84.12,11.57) v1(84.12,10.3) v1(84.12,9.03) v1(85.4,83.79) v1(85.4,82.52) v1(85.4,74.9) v1(85.4,73.63) v1(85.4,72.36) v1(85.4,21.73) v1(85.4,20.46) v1(85.4,19.19) v1(85.4,17.92) v1(85.4,10.3) v1(85.4,9.03) v1(86.66,83.79) v1(86.66,73.63) v1(86.66,72.36) v1(86.66,19.19) v1(86.66,9.03) v1(87.94,83.79) v1(87.94,73.63) v1(87.94,72.36) v1(87.94,19.19) v1(87.94,9.03) v1(89.2,83.79) v1(89.2,73.63) v1(89.2,72.36) v1(89.2,19.19) v1(89.2,9.03) v1(90.47,83.79) v1(90.47,73.63) v1(90.47,72.36) v1(90.47,19.19) v1(90.47,9.03) v1(91.75,83.79) v1(91.75,82.52) v1(91.75,74.9) v1(91.75,73.63) v1(91.75,72.36) v1(91.75,21.73) v1(91.75,20.46) v1(91.75,19.19) v1(91.75,17.92) v1(91.75,10.3) v1(91.75,9.03) v1(93.01,83.79) v1(93.01,82.52) v1(93.01,81.25) v1(93.01,79.98) v1(93.01,78.71) v1(93.01,77.44) v1(93.01,76.17) v1(93.01,74.9) v1(93.01,73.63) v1(93.01,72.36) v1(93.01,21.73) v1(93.01,20.46) v1(93.01,19.19) v1(93.01,17.92) v1(93.01,16.65) v1(93.01,15.38) v1(93.01,14.11) v1(93.01,12.84) v1(93.01,11.57) v1(93.01,10.3) v1(93.01,9.03) v1(94.28,83.79) v1(94.28,82.52) v1(94.28,81.25) v1(94.28,79.98) v1(94.28,78.71) v1(94.28,77.44) v1(94.28,76.17) v1(94.28,74.9) v1(94.28,73.63) v1(94.28,72.36) v1(94.28,21.73) v1(94.28,20.46) v1(94.28,19.19) v1(94.28,17.92) v1(94.28,16.65) v1(94.28,15.38) v1(94.28,14.11) v1(94.28,12.84) v1(94.28,11.57) v1(94.28,10.3) v1(94.28,9.03) v1(95.56,83.79) v1(95.56,82.52) v1(95.56,81.25) v1(95.56,79.98) v1(95.56,78.71) v1(95.56,77.44) v1(95.56,76.17) v1(95.56,74.9) v1(95.56,73.63) v1(95.56,72.36) v1(95.56,21.73) v1(95.56,20.46) v1(95.56,19.19) v1(95.56,17.92) v1(95.56,16.65) v1(95.56,15.38) v1(95.56,14.11) v1(95.56,12.84) v1(95.56,11.57) v1(95.56,10.3) v1(95.56,9.03) v1(96.82,83.79) v1(96.82,82.52) v1(96.82,81.25) v1(96.82,79.98) v1(96.82,78.71) v1(96.82,77.44) v1(96.82,76.17) v1(96.82,74.9) v1(96.82,73.63) v1(96.82,72.36) v1(96.82,21.73) v1(96.82,20.46) v1(96.82,19.19) v1(96.82,17.92) v1(96.82,16.65) v1(96.82,15.38) v1(96.82,14.11) v1(96.82,12.84) v1(96.82,11.57) v1(96.82,10.3) v1(96.82,9.03) v1(98.09,83.79) v1(98.09,82.52) v1(98.09,81.25) v1(98.09,79.98) v1(98.09,78.71) v1(98.09,77.44) v1(98.09,76.17) v1(98.09,74.9) v1(98.09,73.63) v1(98.09,72.36) v1(98.09,21.73) v1(98.09,20.46) v1(98.09,19.19) v1(98.09,17.92) v1(98.09,16.65) v1(98.09,15.38) v1(98.09,14.11) v1(98.09,12.84) v1(98.09,11.57) v1(98.09,10.3) v1(98.09,9.03) v2(13.19,78.76) v2(13.19,14.1) v2(88.19,78.76) v2(88.19,14.1) v3(38.19,78.76) v3(38.19,14.1) v3(63.19,78.76) v3(63.19,14.1) v4(3.91,72.72) v4(4.04,19.21)
MOS_D:
  vias: v1(2.29,62.48) v1(2.29,61.78) v1(2.29,61.08) v1(2.54,31.12) v1(2.54,30.41) v1(2.54,29.72) v1(2.92,62.48) v1(2.92,61.78) v1(2.92,61.09) v1(3.1,56.41) v1(3.1,55.14) v1(3.1,53.87) v1(3.1,52.6) v1(3.1,51.33) v1(3.1,50.06) v1(3.1,48.79) v1(3.1,47.52) v1(3.1,46.25) v1(3.1,44.98) v1(3.1,43.71) v1(3.1,42.44) v1(3.1,41.17) v1(3.1,39.9) v1(3.1,38.63) v1(3.1,37.36) v1(3.17,31.12) v1(3.19,30.41) v1(3.22,29.72) v1(3.56,62.48) v1(3.57,61.78) v1(3.6,61.09) v1(3.81,31.12) v1(3.84,30.41) v1(3.87,29.72) v1(4.19,62.48) v1(4.22,61.78) v1(4.25,61.09) v1(4.37,56.41) v1(4.37,55.14) v1(4.37,53.87) v1(4.37,52.6) v1(4.37,51.33) v1(4.37,50.06) v1(4.37,48.79) v1(4.37,47.52) v1(4.37,46.25) v1(4.37,44.98) v1(4.37,43.71) v1(4.37,42.44) v1(4.37,41.17) v1(4.37,39.9) v1(4.37,38.63) v1(4.37,37.36) v1(4.44,31.12) v1(4.44,30.35) v1(4.5,29.72) v1(4.83,62.48) v1(4.83,61.72) v1(4.88,61.09) v1(5.08,31.12) v1(5.08,30.39) v1(5.08,29.74) v1(5.46,62.48) v1(5.46,61.76) v1(5.46,61.11) v1(5.64,56.41) v1(5.64,55.14) v1(5.64,53.87) v1(5.64,52.6) v1(5.64,51.33) v1(5.64,50.06) v1(5.64,48.79) v1(5.64,47.52) v1(5.64,46.25) v1(5.64,44.98) v1(5.64,43.71) v1(5.64,42.44) v1(5.64,41.17) v1(5.64,39.9) v1(5.64,38.63) v1(5.64,37.36) v1(5.72,31.12) v1(5.72,30.42) v1(5.72,29.72) v1(6.91,56.41) v1(6.91,55.14) v1(6.91,53.87) v1(6.91,52.6) v1(6.91,51.33) v1(6.91,50.06) v1(6.91,48.79) v1(6.91,47.52) v1(6.91,46.25) v1(6.91,44.98) v1(6.91,43.71) v1(6.91,42.44) v1(6.91,41.17) v1(6.91,39.9) v1(6.91,38.63) v1(6.91,37.36) v1(8.18,56.41) v1(8.18,55.14) v1(8.18,53.87) v1(8.18,52.6) v1(8.18,51.33) v1(8.18,50.06) v1(8.18,48.79) v1(8.18,47.52) v1(8.18,46.25) v1(8.18,44.98) v1(8.18,43.71) v1(8.18,42.44) v1(8.18,41.17) v1(8.18,39.9) v1(8.18,38.63) v1(8.18,37.36) v1(9.45,56.41) v1(9.45,55.14) v1(9.45,53.87) v1(9.45,52.6) v1(9.45,51.33) v1(9.45,50.06) v1(9.45,43.71) v1(9.45,42.44) v1(9.45,41.17) v1(9.45,39.9) v1(9.45,38.63) v1(9.45,37.36) v1(10.72,56.41) v1(10.72,55.14) v1(10.72,53.87) v1(10.72,52.6) v1(10.72,51.33) v1(10.72,42.44) v1(10.72,41.17) v1(10.72,39.9) v1(10.72,38.63) v1(10.72,37.36) v1(11.99,56.41) v1(11.99,55.14) v1(11.99,53.87) v1(11.99,52.6) v1(11.99,51.33) v1(11.99,42.44) v1(11.99,41.17) v1(11.99,39.9) v1(11.99,38.63) v1(11.99,37.36) v1(13.26,56.41) v1(13.26,55.14) v1(13.26,53.87) v1(13.26,52.6) v1(13.26,41.17) v1(13.26,39.9) v1(13.26,38.63) v1(13.26,37.36) v1(14.53,56.41) v1(14.53,55.14) v1(14.53,53.87) v1(14.53,52.6) v1(14.53,51.33) v1(14.53,42.44) v1(14.53,41.17) v1(14.53,39.9) v1(14.53,38.63) v1(14.53,37.36) v1(15.8,56.41) v1(15.8,55.14) v1(15.8,53.87) v1(15.8,52.6) v1(15.8,51.33) v1(15.8,42.44) v1(15.8,41.17) v1(15.8,39.9) v1(15.8,38.63) v1(15.8,37.36) v1(17.07,56.41) v1(17.07,55.14) v1(17.07,53.87) v1(17.07,52.6) v1(17.07,51.33) v1(17.07,50.06) v1(17.07,43.71) v1(17.07,42.44) v1(17.07,41.17) v1(17.07,39.9) v1(17.07,38.63) v1(17.07,37.36) v1(18.34,56.41) v1(18.34,55.14) v1(18.34,53.87) v1(18.34,52.6) v1(18.34,51.33) v1(18.34,50.06) v1(18.34,48.79) v1(18.34,47.52) v1(18.34,46.25) v1(18.34,44.98) v1(18.34,43.71) v1(18.34,42.44) v1(18.34,41.17) v1(18.34,39.9) v1(18.34,38.63) v1(18.34,37.36) v1(19.61,56.41) v1(19.61,55.14) v1(19.61,53.87) v1(19.61,52.6) v1(19.61,51.33) v1(19.61,50.06) v1(19.61,48.79) v1(19.61,47.52) v1(19.61,46.25) v1(19.61,44.98) v1(19.61,43.71) v1(19.61,42.44) v1(19.61,41.17) v1(19.61,39.9) v1(19.61,38.63) v1(19.61,37.36) v1(20.88,56.41) v1(20.88,55.14) v1(20.88,53.87) v1(20.88,52.6) v1(20.88,51.33) v1(20.88,50.06) v1(20.88,48.79) v1(20.88,47.52) v1(20.88,46.25) v1(20.88,44.98) v1(20.88,43.71) v1(20.88,42.44) v1(20.88,41.17) v1(20.88,39.9) v1(20.88,38.63) v1(20.88,37.36) v1(22.15,56.41) v1(22.15,55.14) v1(22.15,53.87) v1(22.15,52.6) v1(22.15,51.33) v1(22.15,50.06) v1(22.15,48.79) v1(22.15,47.52) v1(22.15,46.25) v1(22.15,44.98) v1(22.15,43.71) v1(22.15,42.44) v1(22.15,41.17) v1(22.15,39.9) v1(22.15,38.63) v1(22.15,37.36) v1(23.42,56.41) v1(23.42,55.14) v1(23.42,53.87) v1(23.42,52.6) v1(23.42,51.33) v1(23.42,50.06) v1(23.42,48.79) v1(23.42,47.52) v1(23.42,46.25) v1(23.42,44.98) v1(23.42,43.71) v1(23.42,42.44) v1(23.42,41.17) v1(23.42,39.9) v1(23.42,38.63) v1(23.42,37.36) v1(24.69,56.41) v1(24.69,55.14) v1(24.69,53.87) v1(24.69,52.6) v1(24.69,51.33) v1(24.69,50.06) v1(24.69,48.79) v1(24.69,47.52) v1(24.69,46.25) v1(24.69,44.98) v1(24.69,43.71) v1(24.69,42.44) v1(24.69,41.17) v1(24.69,39.9) v1(24.69,38.63) v1(24.69,37.36) v1(25.96,56.41) v1(25.96,55.14) v1(25.96,53.87) v1(25.96,52.6) v1(25.96,51.33) v1(25.96,50.06) v1(25.96,48.79) v1(25.96,47.52) v1(25.96,46.25) v1(25.96,44.98) v1(25.96,43.71) v1(25.96,42.44) v1(25.96,41.17) v1(25.96,39.9) v1(25.96,38.63) v1(25.96,37.36) v1(27.23,56.41) v1(27.23,55.14) v1(27.23,53.87) v1(27.23,52.6) v1(27.23,51.33) v1(27.23,50.06) v1(27.23,48.79) v1(27.23,47.52) v1(27.23,46.25) v1(27.23,44.98) v1(27.23,43.71) v1(27.23,42.44) v1(27.23,41.17) v1(27.23,39.9) v1(27.23,38.63) v1(27.23,37.36) v1(28.5,56.41) v1(28.5,55.14) v1(28.5,53.87) v1(28.5,52.6) v1(28.5,51.33) v1(28.5,50.06) v1(28.5,48.79) v1(28.5,47.52) v1(28.5,46.25) v1(28.5,44.98) v1(28.5,43.71) v1(28.5,42.44) v1(28.5,41.17) v1(28.5,39.9) v1(28.5,38.63) v1(28.5,37.36) v1(29.77,56.41) v1(29.77,55.14) v1(29.77,53.87) v1(29.77,52.6) v1(29.77,51.33) v1(29.77,50.06) v1(29.77,48.79) v1(29.77,47.52) v1(29.77,46.25) v1(29.77,44.98) v1(29.77,43.71) v1(29.77,42.44) v1(29.77,41.17) v1(29.77,39.9) v1(29.77,38.63) v1(29.77,37.36) v1(31.04,56.41) v1(31.04,55.14) v1(31.04,53.87) v1(31.04,52.6) v1(31.04,51.33) v1(31.04,50.06) v1(31.04,48.79) v1(31.04,47.52) v1(31.04,46.25) v1(31.04,44.98) v1(31.04,43.71) v1(31.04,42.44) v1(31.04,41.17) v1(31.04,39.9) v1(31.04,38.63) v1(31.04,37.36) v1(32.31,56.41) v1(32.31,55.14) v1(32.31,53.87) v1(32.31,52.6) v1(32.31,51.33) v1(32.31,50.06) v1(32.31,48.79) v1(32.31,47.52) v1(32.31,46.25) v1(32.31,44.98) v1(32.31,43.71) v1(32.31,42.44) v1(32.31,41.17) v1(32.31,39.9) v1(32.31,38.63) v1(32.31,37.36) v1(33.58,56.41) v1(33.58,55.14) v1(33.58,53.87) v1(33.58,52.6) v1(33.58,51.33) v1(33.58,50.06) v1(33.58,48.79) v1(33.58,47.52) v1(33.58,46.25) v1(33.58,44.98) v1(33.58,43.71) v1(33.58,42.44) v1(33.58,41.17) v1(33.58,39.9) v1(33.58,38.63) v1(33.58,37.36) v1(34.85,56.41) v1(34.85,55.14) v1(34.85,53.87) v1(34.85,52.6) v1(34.85,51.33) v1(34.85,50.06) v1(34.85,48.79) v1(34.85,44.98) v1(34.85,43.71) v1(34.85,42.44) v1(34.85,41.17) v1(34.85,39.9) v1(34.85,38.63) v1(34.85,37.36) v1(36.12,56.41) v1(36.12,55.14) v1(36.12,53.87) v1(36.12,52.6) v1(36.12,51.33) v1(36.12,50.06) v1(36.12,43.71) v1(36.12,42.44) v1(36.12,41.17) v1(36.12,39.9) v1(36.12,38.63) v1(36.12,37.36) v1(37.39,56.41) v1(37.39,55.14) v1(37.39,53.87) v1(37.39,52.6) v1(37.39,51.33) v1(37.39,42.44) v1(37.39,41.17) v1(37.39,39.9) v1(37.39,38.63) v1(37.39,37.36) v1(38.66,56.41) v1(38.66,55.14) v1(38.66,53.87) v1(38.66,52.6) v1(38.66,51.33) v1(38.66,42.44) v1(38.66,41.17) v1(38.66,39.9) v1(38.66,38.63) v1(38.66,37.36) v1(39.93,56.41) v1(39.93,55.14) v1(39.93,53.87) v1(39.93,52.6) v1(39.93,51.33) v1(39.93,50.06) v1(39.93,43.71) v1(39.93,42.44) v1(39.93,41.17) v1(39.93,39.9) v1(39.93,38.63) v1(39.93,37.36) v1(41.2,56.41) v1(41.2,55.14) v1(41.2,53.87) v1(41.2,52.6) v1(41.2,51.33) v1(41.2,50.06) v1(41.2,48.79) v1(41.2,43.71) v1(41.2,42.44) v1(41.2,41.17) v1(41.2,39.9) v1(41.2,38.63) v1(41.2,37.36) v1(42.47,56.41) v1(42.47,55.14) v1(42.47,53.87) v1(42.47,52.6) v1(42.47,51.33) v1(42.47,50.06) v1(42.47,48.79) v1(42.47,47.52) v1(42.47,46.25) v1(42.47,44.98) v1(42.47,43.71) v1(42.47,42.44) v1(42.47,41.17) v1(42.47,39.9) v1(42.47,38.63) v1(42.47,37.36) v1(43.74,56.41) v1(43.74,55.14) v1(43.74,53.87) v1(43.74,52.6) v1(43.74,51.33) v1(43.74,50.06) v1(43.74,48.79) v1(43.74,47.52) v1(43.74,46.25) v1(43.74,44.98) v1(43.74,43.71) v1(43.74,42.44) v1(43.74,41.17) v1(43.74,39.9) v1(43.74,38.63) v1(43.74,37.36) v1(45.01,56.41) v1(45.01,55.14) v1(45.01,53.87) v1(45.01,52.6) v1(45.01,51.33) v1(45.01,50.06) v1(45.01,48.79) v1(45.01,47.52) v1(45.01,46.25) v1(45.01,44.98) v1(45.01,43.71) v1(45.01,42.44) v1(45.01,41.17) v1(45.01,39.9) v1(45.01,38.63) v1(45.01,37.36) v1(46.28,56.41) v1(46.28,55.14) v1(46.28,53.87) v1(46.28,52.6) v1(46.28,51.33) v1(46.28,50.06) v1(46.28,48.79) v1(46.28,47.52) v1(46.28,46.25) v1(46.28,44.98) v1(46.28,43.71) v1(46.28,42.44) v1(46.28,41.17) v1(46.28,39.9) v1(46.28,38.63) v1(46.28,37.36) v1(47.55,56.41) v1(47.55,55.14) v1(47.55,53.87) v1(47.55,52.6) v1(47.55,51.33) v1(47.55,50.06) v1(47.55,48.79) v1(47.55,47.52) v1(47.55,46.25) v1(47.55,44.98) v1(47.55,43.71) v1(47.55,42.44) v1(47.55,41.17) v1(47.55,39.9) v1(47.55,38.63) v1(47.55,37.36) v1(48.82,56.41) v1(48.82,55.14) v1(48.82,53.87) v1(48.82,52.6) v1(48.82,51.33) v1(48.82,50.06) v1(48.82,48.79) v1(48.82,47.52) v1(48.82,46.25) v1(48.82,44.98) v1(48.82,43.71) v1(48.82,42.44) v1(48.82,41.17) v1(48.82,39.9) v1(48.82,38.63) v1(48.82,37.36) v1(50.09,56.41) v1(50.09,55.14) v1(50.09,53.87) v1(50.09,52.6) v1(50.09,51.33) v1(50.09,50.06) v1(50.09,48.79) v1(50.09,47.52) v1(50.09,46.25) v1(50.09,44.98) v1(50.09,43.71) v1(50.09,42.44) v1(50.09,41.17) v1(50.09,39.9) v1(50.09,38.63) v1(50.09,37.36) v1(51.36,56.41) v1(51.36,55.14) v1(51.36,53.87) v1(51.36,52.6) v1(51.36,51.33) v1(51.36,50.06) v1(51.36,48.79) v1(51.36,47.52) v1(51.36,46.25) v1(51.36,44.98) v1(51.36,43.71) v1(51.36,42.44) v1(51.36,41.17) v1(51.36,39.9) v1(51.36,38.63) v1(51.36,37.36) v1(52.63,56.41) v1(52.63,55.14) v1(52.63,53.87) v1(52.63,52.6) v1(52.63,51.33) v1(52.63,50.06) v1(52.63,48.79) v1(52.63,47.52) v1(52.63,46.25) v1(52.63,44.98) v1(52.63,43.71) v1(52.63,42.44) v1(52.63,41.17) v1(52.63,39.9) v1(52.63,38.63) v1(52.63,37.36) v1(53.9,56.41) v1(53.9,55.14) v1(53.9,53.87) v1(53.9,52.6) v1(53.9,51.33) v1(53.9,50.06) v1(53.9,48.79) v1(53.9,47.52) v1(53.9,46.25) v1(53.9,44.98) v1(53.9,43.71) v1(53.9,42.44) v1(53.9,41.17) v1(53.9,39.9) v1(53.9,38.63) v1(53.9,37.36) v1(55.17,56.41) v1(55.17,55.14) v1(55.17,53.87) v1(55.17,52.6) v1(55.17,51.33) v1(55.17,50.06) v1(55.17,48.79) v1(55.17,47.52) v1(55.17,46.25) v1(55.17,44.98) v1(55.17,43.71) v1(55.17,42.44) v1(55.17,41.17) v1(55.17,39.9) v1(55.17,38.63) v1(55.17,37.36) v1(56.44,56.41) v1(56.44,55.14) v1(56.44,53.87) v1(56.44,52.6) v1(56.44,51.33) v1(56.44,50.06) v1(56.44,48.79) v1(56.44,47.52) v1(56.44,46.25) v1(56.44,44.98) v1(56.44,43.71) v1(56.44,42.44) v1(56.44,41.17) v1(56.44,39.9) v1(56.44,38.63) v1(56.44,37.36) v1(57.71,56.41) v1(57.71,55.14) v1(57.71,53.87) v1(57.71,52.6) v1(57.71,51.33) v1(57.71,50.06) v1(57.71,48.79) v1(57.71,47.52) v1(57.71,46.25) v1(57.71,44.98) v1(57.71,43.71) v1(57.71,42.44) v1(57.71,41.17) v1(57.71,39.9) v1(57.71,38.63) v1(57.71,37.36) v1(58.98,56.41) v1(58.98,55.14) v1(58.98,53.87) v1(58.98,52.6) v1(58.98,51.33) v1(58.98,50.06) v1(58.98,48.79) v1(58.98,47.52) v1(58.98,46.25) v1(58.98,44.98) v1(58.98,43.71) v1(58.98,42.44) v1(58.98,41.17) v1(58.98,39.9) v1(58.98,38.63) v1(58.98,37.36) v1(60.25,56.41) v1(60.25,55.14) v1(60.25,53.87) v1(60.25,52.6) v1(60.25,51.33) v1(60.25,50.06) v1(60.25,43.71) v1(60.25,42.44) v1(60.25,41.17) v1(60.25,39.9) v1(60.25,38.63) v1(60.25,37.36) v1(61.52,56.41) v1(61.52,55.14) v1(61.52,53.87) v1(61.52,52.6) v1(61.52,51.33) v1(61.52,50.06) v1(61.52,43.71) v1(61.52,42.44) v1(61.52,41.17) v1(61.52,39.9) v1(61.52,38.63) v1(61.52,37.36) v1(62.79,56.41) v1(62.79,55.14) v1(62.79,53.87) v1(62.79,52.6) v1(62.79,51.33) v1(62.79,42.44) v1(62.79,41.17) v1(62.79,39.9) v1(62.79,38.63) v1(62.79,37.36) v1(64.06,56.41) v1(64.06,55.14) v1(64.06,53.87) v1(64.06,52.6) v1(64.06,51.33) v1(64.06,42.44) v1(64.06,41.17) v1(64.06,39.9) v1(64.06,38.63) v1(64.06,37.36) v1(65.33,56.41) v1(65.33,55.14) v1(65.33,53.87) v1(65.33,52.6) v1(65.33,51.33) v1(65.33,50.06) v1(65.33,43.71) v1(65.33,42.44) v1(65.33,41.17) v1(65.33,39.9) v1(65.33,38.63) v1(65.33,37.36) v1(66.6,56.41) v1(66.6,55.14) v1(66.6,53.87) v1(66.6,52.6) v1(66.6,51.33) v1(66.6,50.06) v1(66.6,48.79) v1(66.6,44.98) v1(66.6,43.71) v1(66.6,42.44) v1(66.6,41.17) v1(66.6,39.9) v1(66.6,38.63) v1(66.6,37.36) v1(67.87,56.41) v1(67.87,55.14) v1(67.87,53.87) v1(67.87,52.6) v1(67.87,51.33) v1(67.87,50.06) v1(67.87,48.79) v1(67.87,47.52) v1(67.87,46.25) v1(67.87,44.98) v1(67.87,43.71) v1(67.87,42.44) v1(67.87,41.17) v1(67.87,39.9) v1(67.87,38.63) v1(67.87,37.36) v1(69.14,56.41) v1(69.14,55.14) v1(69.14,53.87) v1(69.14,52.6) v1(69.14,51.33) v1(69.14,50.06) v1(69.14,48.79) v1(69.14,47.52) v1(69.14,46.25) v1(69.14,44.98) v1(69.14,43.71) v1(69.14,42.44) v1(69.14,41.17) v1(69.14,39.9) v1(69.14,38.63) v1(69.14,37.36) v1(70.41,56.41) v1(70.41,55.14) v1(70.41,53.87) v1(70.41,52.6) v1(70.41,51.33) v1(70.41,50.06) v1(70.41,48.79) v1(70.41,47.52) v1(70.41,46.25) v1(70.41,44.98) v1(70.41,43.71) v1(70.41,42.44) v1(70.41,41.17) v1(70.41,39.9) v1(70.41,38.63) v1(70.41,37.36) v1(71.68,56.41) v1(71.68,55.14) v1(71.68,53.87) v1(71.68,52.6) v1(71.68,51.33) v1(71.68,50.06) v1(71.68,48.79) v1(71.68,47.52) v1(71.68,46.25) v1(71.68,44.98) v1(71.68,43.71) v1(71.68,42.44) v1(71.68,41.17) v1(71.68,39.9) v1(71.68,38.63) v1(71.68,37.36) v1(72.24,91.26) v1(72.77,91.26) v1(72.95,56.41) v1(72.95,55.14) v1(72.95,53.87) v1(72.95,52.6) v1(72.95,51.33) v1(72.95,50.06) v1(72.95,48.79) v1(72.95,47.52) v1(72.95,46.25) v1(72.95,44.98) v1(72.95,43.71) v1(72.95,42.44) v1(72.95,41.17) v1(72.95,39.9) v1(72.95,38.63) v1(72.95,37.36) v1(73.3,91.26) v1(74.22,56.41) v1(74.22,55.14) v1(74.22,53.87) v1(74.22,52.6) v1(74.22,51.33) v1(74.22,50.06) v1(74.22,48.79) v1(74.22,47.52) v1(74.22,46.25) v1(74.22,44.98) v1(74.22,43.71) v1(74.22,42.44) v1(74.22,41.17) v1(74.22,39.9) v1(74.22,38.63) v1(74.22,37.36) v1(75.49,56.41) v1(75.49,55.14) v1(75.49,53.87) v1(75.49,52.6) v1(75.49,51.33) v1(75.49,50.06) v1(75.49,48.79) v1(75.49,47.52) v1(75.49,46.25) v1(75.49,44.98) v1(75.49,43.71) v1(75.49,42.44) v1(75.49,41.17) v1(75.49,39.9) v1(75.49,38.63) v1(75.49,37.36) v1(76.76,56.41) v1(76.76,55.14) v1(76.76,53.87) v1(76.76,52.6) v1(76.76,51.33) v1(76.76,50.06) v1(76.76,48.79) v1(76.76,47.52) v1(76.76,46.25) v1(76.76,44.98) v1(76.76,43.71) v1(76.76,42.44) v1(76.76,41.17) v1(76.76,39.9) v1(76.76,38.63) v1(76.76,37.36) v1(78.03,56.41) v1(78.03,55.14) v1(78.03,53.87) v1(78.03,52.6) v1(78.03,51.33) v1(78.03,50.06) v1(78.03,48.79) v1(78.03,47.52) v1(78.03,46.25) v1(78.03,44.98) v1(78.03,43.71) v1(78.03,42.44) v1(78.03,41.17) v1(78.03,39.9) v1(78.03,38.63) v1(78.03,37.36) v1(79.3,56.41) v1(79.3,55.14) v1(79.3,53.87) v1(79.3,52.6) v1(79.3,51.33) v1(79.3,50.06) v1(79.3,48.79) v1(79.3,47.52) v1(79.3,46.25) v1(79.3,44.98) v1(79.3,43.71) v1(79.3,42.44) v1(79.3,41.17) v1(79.3,39.9) v1(79.3,38.63) v1(79.3,37.36) v1(80.57,56.41) v1(80.57,55.14) v1(80.57,53.87) v1(80.57,52.6) v1(80.57,51.33) v1(80.57,50.06) v1(80.57,48.79) v1(80.57,47.52) v1(80.57,46.25) v1(80.57,44.98) v1(80.57,43.71) v1(80.57,42.44) v1(80.57,41.17) v1(80.57,39.9) v1(80.57,38.63) v1(80.57,37.36) v1(81.84,56.41) v1(81.84,55.14) v1(81.84,53.87) v1(81.84,52.6) v1(81.84,51.33) v1(81.84,50.06) v1(81.84,48.79) v1(81.84,47.52) v1(81.84,46.25) v1(81.84,44.98) v1(81.84,43.71) v1(81.84,42.44) v1(81.84,41.17) v1(81.84,39.9) v1(81.84,38.63) v1(81.84,37.36) v1(83.11,56.41) v1(83.11,55.14) v1(83.11,53.87) v1(83.11,52.6) v1(83.11,51.33) v1(83.11,50.06) v1(83.11,48.79) v1(83.11,47.52) v1(83.11,46.25) v1(83.11,44.98) v1(83.11,43.71) v1(83.11,42.44) v1(83.11,41.17) v1(83.11,39.9) v1(83.11,38.63) v1(83.11,37.36) v1(84.38,56.41) v1(84.38,55.14) v1(84.38,53.87) v1(84.38,52.6) v1(84.38,51.33) v1(84.38,50.06) v1(84.38,43.71) v1(84.38,42.44) v1(84.38,41.17) v1(84.38,39.9) v1(84.38,38.63) v1(84.38,37.36) v1(85.65,56.41) v1(85.65,55.14) v1(85.65,53.87) v1(85.65,52.6) v1(85.65,51.33) v1(85.65,42.44) v1(85.65,41.17) v1(85.65,39.9) v1(85.65,38.63) v1(85.65,37.36) v1(86.92,56.41) v1(86.92,55.14) v1(86.92,53.87) v1(86.92,52.6) v1(86.92,51.33) v1(86.92,42.44) v1(86.92,41.17) v1(86.92,39.9) v1(86.92,38.63) v1(86.92,37.36) v1(88.19,56.41) v1(88.19,55.14) v1(88.19,53.87) v1(88.19,52.6) v1(88.19,41.17) v1(88.19,39.9) v1(88.19,38.63) v1(88.19,37.36) v1(89.46,56.41) v1(89.46,55.14) v1(89.46,53.87) v1(89.46,52.6) v1(89.46,51.33) v1(89.46,42.44) v1(89.46,41.17) v1(89.46,39.9) v1(89.46,38.63) v1(89.46,37.36) v1(90.73,56.41) v1(90.73,55.14) v1(90.73,53.87) v1(90.73,52.6) v1(90.73,51.33) v1(90.73,42.44) v1(90.73,41.17) v1(90.73,39.9) v1(90.73,38.63) v1(90.73,37.36) v1(92,56.41) v1(92,55.14) v1(92,53.87) v1(92,52.6) v1(92,51.33) v1(92,50.06) v1(92,43.71) v1(92,42.44) v1(92,41.17) v1(92,39.9) v1(92,38.63) v1(92,37.36) v1(93.27,56.41) v1(93.27,55.14) v1(93.27,53.87) v1(93.27,52.6) v1(93.27,51.33) v1(93.27,50.06) v1(93.27,48.79) v1(93.27,47.52) v1(93.27,46.25) v1(93.27,44.98) v1(93.27,43.71) v1(93.27,42.44) v1(93.27,41.17) v1(93.27,39.9) v1(93.27,38.63) v1(93.27,37.36) v1(94.54,56.41) v1(94.54,55.14) v1(94.54,53.87) v1(94.54,52.6) v1(94.54,51.33) v1(94.54,50.06) v1(94.54,48.79) v1(94.54,47.52) v1(94.54,46.25) v1(94.54,44.98) v1(94.54,43.71) v1(94.54,42.44) v1(94.54,41.17) v1(94.54,39.9) v1(94.54,38.63) v1(94.54,37.36) v1(95.81,56.41) v1(95.81,55.14) v1(95.81,53.87) v1(95.81,52.6) v1(95.81,51.33) v1(95.81,50.06) v1(95.81,48.79) v1(95.81,47.52) v1(95.81,46.25) v1(95.81,44.98) v1(95.81,43.71) v1(95.81,42.44) v1(95.81,41.17) v1(95.81,39.9) v1(95.81,38.63) v1(95.81,37.36) v1(97.08,56.41) v1(97.08,55.14) v1(97.08,53.87) v1(97.08,52.6) v1(97.08,51.33) v1(97.08,50.06) v1(97.08,48.79) v1(97.08,47.52) v1(97.08,46.25) v1(97.08,44.98) v1(97.08,43.71) v1(97.08,42.44) v1(97.08,41.17) v1(97.08,39.9) v1(97.08,38.63) v1(97.08,37.36) v1(98.35,56.41) v1(98.35,55.14) v1(98.35,53.87) v1(98.35,52.6) v1(98.35,51.33) v1(98.35,50.06) v1(98.35,48.79) v1(98.35,47.52) v1(98.35,46.25) v1(98.35,44.98) v1(98.35,43.71) v1(98.35,42.44) v1(98.35,41.17) v1(98.35,39.9) v1(98.35,38.63) v1(98.35,37.36) v2(13.19,46.86) v2(88.19,46.86) v3(38.19,46.86) v3(63.19,46.86) v4(3.84,32.79) v4(3.99,59.41)
MOS_G:
  vias: v5(44.05,90.86) v5(44.07,1.65)
$1N10367:
  vias: v1(17.53,70.61) v1(38.23,88.27)
$1N10753:
  vias: v1(29.21,70.61) v1(39.88,88.27)
$1N10869:
  vias: v1(40.77,70.74) v1(41.4,88.27)
$1N10985:
  vias: v1(43.05,88.27) v1(52.45,70.61)
$1N11101:
  vias: v1(50.29,88.27) v1(64.13,70.61)
$1N11217:
  vias: v1(51.94,88.27) v1(75.82,70.61)
$1N64306:
  vias: v1(53.65,88.21) v1(87.5,70.61)
$1N64637:
  vias: v1(55.37,88.27) v1(97.92,70.74)
$1N106030:
  vias: v1(53.67,4.19) v1(76.58,22.1)
$1N106031:
  vias: v1(51.94,4.19) v1(65.02,22.1)
$1N106032:
  vias: v1(50.29,4.19) v1(53.21,22.23)
$1N106033:
  vias: v1(55.37,4.19) v1(88.26,22.1)
$1N106034:
  vias: v1(41.53,22.1) v1(43.05,4.32)
$1N106035:
  vias: v1(29.97,22.1) v1(41.4,4.32)
$1N106036:
  vias: v1(18.41,25.65) v1(39.88,4.32)
$1N106037:
  vias: v1(6.98,22.35) v1(38.23,4.32)

## Copper pours and planes (outline as drawn; the poured copper is in the pictures)
GND on Top Layer: 44.32,89.79 49.22,89.79 49.22,82.93 44.32,82.93
GND on Top Layer: 0.89,25.02 6.35,25.02 6.35,18.54 0.89,18.54
GND on Top Layer: 105.19,25.11 90.27,25.11 90.26,25.12 90.26,20.67 86.9,20.67 86.9,25.11 78.71,25.11 78.7,25.12 78.7,20.67 75.17,20.67 75.17,25.24 66.83,25.24 66.83,20.8 63.4,20.8 63.4,25.24 55.23,25.24 55.21,25.22 55.21,20.88 51.84,20.8 51.72,20.8 51.72,25.11 43.72,25.11 43.65,25.18 43.59,25.11 43.59,20.8 40.16,20.8 40.16,25.24 31.91,25.24 31.91,20.8 28.39,20.8 28.39,25.2 20.31,25.2 20.22,25.11 20.22,20.8 16.67,20.8 16.67,25.24 8.66,25.24 8.54,25.11 8.54,20.8 1.83,20.8 0.03,19 0.03,7.72 105.31,7.72 105.31,24.99
GND on Top Layer: 44.17,9.78 48.9,9.78 48.9,2.92 44.17,2.92
GND on Top Layer: 0.51,67.56 15.42,67.56 15.43,67.55 15.43,72.01 18.8,72.01 18.8,67.56 26.98,67.56 26.99,67.55 26.99,72.01 30.52,72.01 30.52,67.44 38.86,67.44 38.86,71.88 42.29,71.88 42.29,67.44 50.46,67.44 50.48,67.46 50.48,71.8 53.85,71.88 53.97,71.88 53.97,67.56 61.98,67.56 62.04,67.5 62.1,67.56 62.1,71.88 65.53,71.88 65.53,67.44 73.79,67.44 73.79,71.88 77.3,71.88 77.3,67.48 85.38,67.48 85.47,67.56 85.47,71.88 89.03,71.88 89.03,67.44 97.03,67.44 97.16,67.56 97.16,71.88 100.44,71.88 100.45,71.89 100.45,84.95 100.46,84.96 0.38,84.96 0.38,67.69
GND on Bottom Layer: 2.16,73.66 15.06,73.66 15.06,67.95 2.16,67.95
GND on Bottom Layer: 1.91,25.27 6.3,25.27 6.3,19.57 1.91,19.57
MOS_D on Top Layer: 1.4,61.98 -2.41,61.98 -2.41,30.1 0.38,27.31 106.93,27.31 114.05,34.42 114.05,60.2 108.33,65.91 5.33,65.91
MOS_D on Top Layer: 72.01,91.59 73.53,91.59 73.53,87.12 72.01,87.12
MOS_D on Bottom Layer: 2.02,65.78 107.7,65.78 107.7,27.43 2.02,27.43

## Text on the board
Top Layer: 蜗牛点焊机MOS板 V1.0B
Top Solder Mask Layer: 蜗牛点焊机MOS板 V1.0B
Top Silkscreen Layer: ⬇此处接超级电容负极 | D G S
